# Altium project Audio-Switch-v2.0.PrjPcb (part 2 of 3)

## Sheet I2S-to-SPDIF-Sheet.SchDoc
size 420 x 297 mm; SheetNumber: 5; SheetTotal: 5
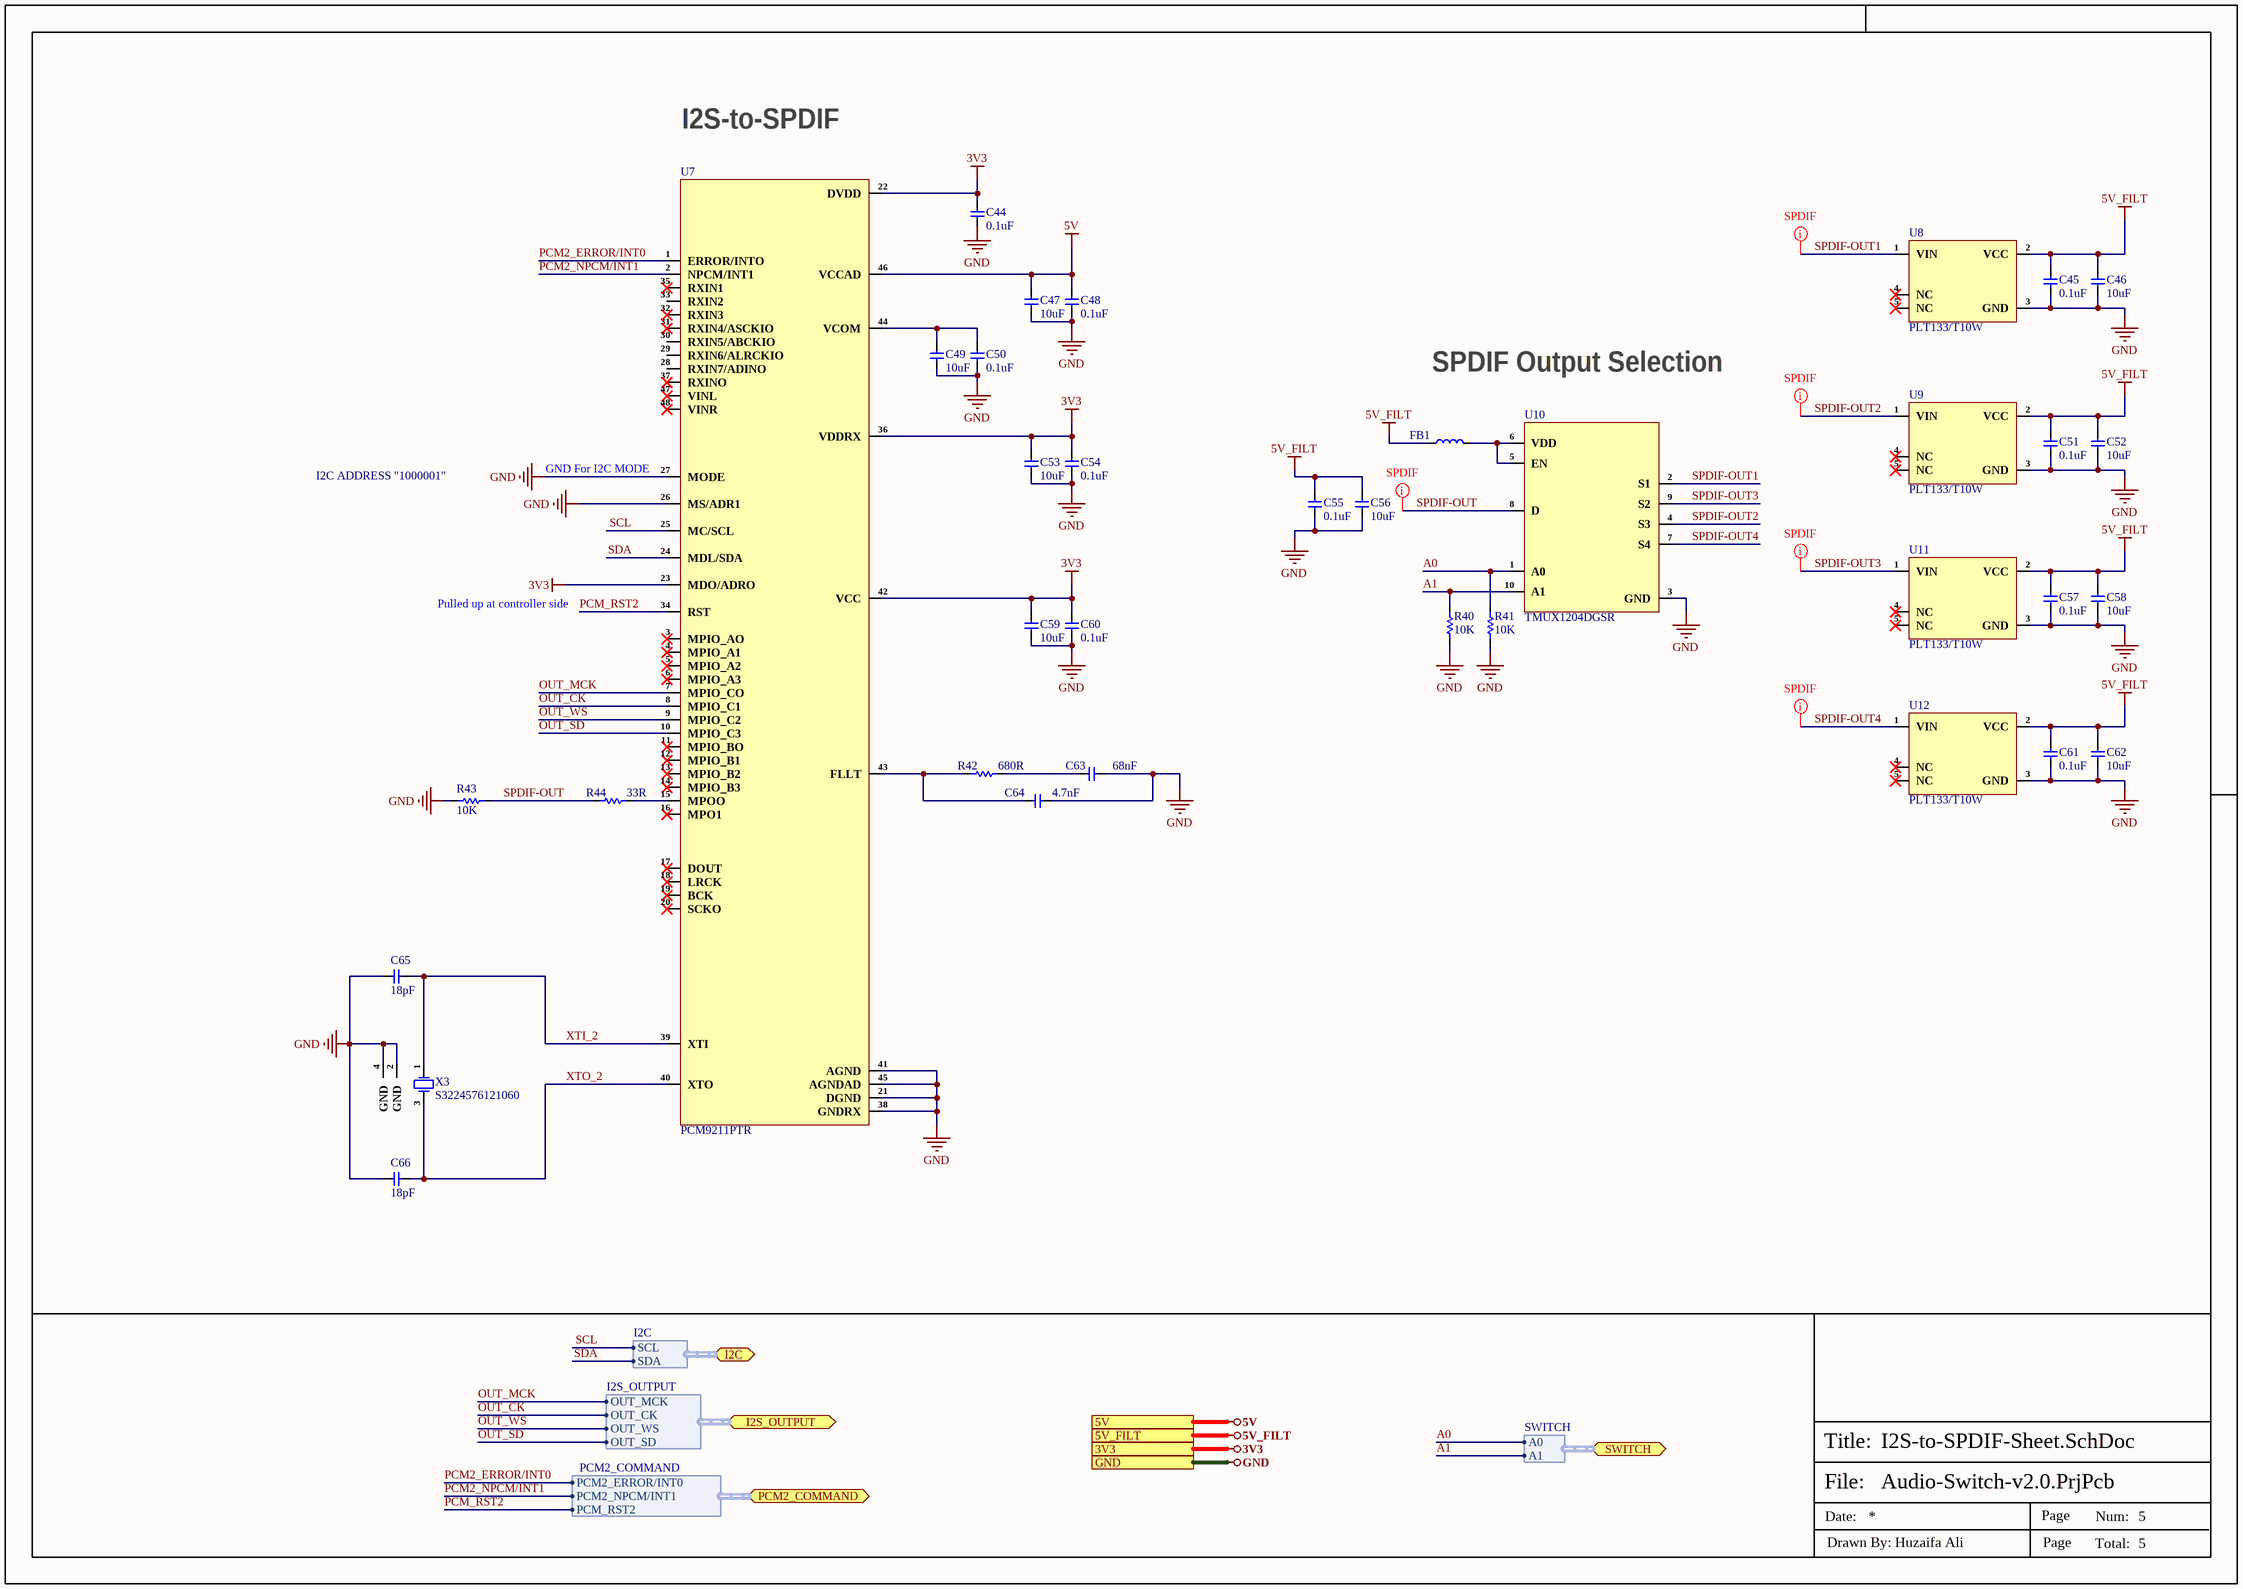
[diagram p2: I2S-to-SPDIF-Sheet.SchDoc]

### Parts
C44  0.1uF  [Cap-0402]
C45  0.1uF  [Cap-0402]
C46  10uF  [Cap-0402]
C47  10uF  [Cap-0402]
C48  0.1uF  [Cap-0402]
C49  10uF  [Cap-0402]
C50  0.1uF  [Cap-0402]
C51  0.1uF  [Cap-0402]
C52  10uF  [Cap-0402]
C53  10uF  [Cap-0402]
C54  0.1uF  [Cap-0402]
C55  0.1uF  [Cap-0402]
C56  10uF  [Cap-0402]
C57  0.1uF  [Cap-0402]
C58  10uF  [Cap-0402]
C59  10uF  [Cap-0402]
C60  0.1uF  [Cap-0402]
C61  0.1uF  [Cap-0402]
C62  10uF  [Cap-0402]
C63  68nF  [Cap-0402]
C64  4.7nF  [Cap-0402]
C65  18pF  [Cap-0402]
C66  18pF  [Cap-0402]
FB1  BLM18SG121TN1D  [IND-0603 (1608 Metric)]  (value not drawn)
R40  10K  [Res-0402]
R41  10K  [Res-0402]
R42  680R  [Res-0402]
R43  10K  [Res-0402]
R44  33R  [Res-0402]
U7  PCM9211PTR  [48-LQFP (7x7)]
U8  PLT133/T10W  [PLT133/T10W]
U9  PLT133/T10W  [PLT133/T10W]
U10  TMUX1204DGSR  [VSSOP-10]
U11  PLT133/T10W  [PLT133/T10W]
U12  PLT133/T10W  [PLT133/T10W]
X3  S3224576121060  [S3224576121060_]

### Ports
3V3 (see Top_Sheet[5B], Controller-Sheet[2D], Power-Sheet[4D], SPDIF-to-I2S-Sheet[3D]), 5V (see Top_Sheet[5A], Power-Sheet[4D], SPDIF-to-I2S-Sheet[3D]), 5V_FILT (see Top_Sheet[5A], Power-Sheet[4D], SPDIF-to-I2S-Sheet[3D]), GND (see Top_Sheet[5B], Controller-Sheet[2D], Power-Sheet[4D], SPDIF-to-I2S-Sheet[3D]), I2C (bidir, harness I2C, see Top_Sheet[5B], Controller-Sheet[2D], SPDIF-to-I2S-Sheet[2D]), I2S_OUTPUT (bidir, harness I2S_OUTPUT, see Top_Sheet[5B], Controller-Sheet[4D]), PCM2_COMMAND (bidir, harness PCM2_COMMAND, see Top_Sheet[5B], Controller-Sheet[5D]), SWITCH (bidir, harness SWITCH, see Top_Sheet[5B], Controller-Sheet[4D])

### Harnesses
I2C: SCL, SDA
PCM2_COMMAND: PCM2_ERROR/INT0, PCM2_NPCM/INT1, PCM_RST2
SWITCH: A0, A1
I2S_OUTPUT: OUT_MCK, OUT_CK, OUT_WS, OUT_SD

### Nets
3V3: C44.2 C53.2 C54.2 C59.2 C60.2 U7.22(DVDD) U7.23(MDO/ADRO) U7.36(VDDRX) U7.42(VCC) ; port 3V3
5V: C47.2 C48.2 U7.46(VCCAD) ; port 5V
5V_FILT: C45.2 C46.2 C51.2 C52.2 C55.2 C56.2 C57.2 C58.2 C61.2 C62.2 FB1.1 U8.2(VCC) U9.2(VCC) U11.2(VCC) U12.2(VCC) ; port 5V_FILT
GND: C44.1 C45.1 C46.1 C47.1 C48.1 C49.1 C50.1 C51.1 C52.1 C53.1 C54.1 C55.1 C56.1 C57.1 C58.1 C59.1 C60.1 C61.1 C62.1 C63.2 C64.2 C65.1 C66.1 R40.1 R41.1 R43.1 U7.21(DGND) U7.26(MS/ADR1) U7.27(MODE) U7.38(GNDRX) U7.41(AGND) U7.45(AGNDAD) U8.3(GND) U9.3(GND) U10.3(GND) U11.3(GND) U12.3(GND) X3.2(GND) X3.4(GND) ; port GND
A0: R41.2 U10.1(A0) ; port SWITCH.A0
A1: R40.2 U10.10(A1) ; port SWITCH.A1
OUT_CK: U7.8(MPIO_C1) ; port I2S_OUTPUT.OUT_CK
OUT_MCK: U7.7(MPIO_CO) ; port I2S_OUTPUT.OUT_MCK
OUT_SD: U7.10(MPIO_C3) ; port I2S_OUTPUT.OUT_SD
OUT_WS: U7.9(MPIO_C2) ; port I2S_OUTPUT.OUT_WS
PCM2_ERROR/INT0: U7.1(ERROR/INTO) ; port PCM2_COMMAND.PCM2_ERROR/INT0
PCM2_NPCM/INT1: U7.2(NPCM/INT1) ; port PCM2_COMMAND.PCM2_NPCM/INT1
PCM_RST2: U7.34(RST) ; port PCM2_COMMAND.PCM_RST2
SCL: U7.25(MC/SCL) ; port I2C.SCL  [project net I2C.SCL]
SDA: U7.24(MDL/SDA) ; port I2C.SDA  [project net I2C.SDA]
SPDIF-OUT: R43.2 R44.1 U10.8(D)
SPDIF-OUT1: U8.1(VIN) U10.2(S1)
SPDIF-OUT2: U9.1(VIN) U10.4(S3)
SPDIF-OUT3: U10.9(S2) U11.1(VIN)
SPDIF-OUT4: U10.7(S4) U12.1(VIN)
XTI_2: C65.2 U7.39(XTI) X3.1(OSC1)
XTO_2: C66.2 U7.40(XTO) X3.3(OSC2)
NetC49_2: C49.2 C50.2 U7.44(VCOM)
NetC63_1: C63.1 R42.2
NetC64_1: C64.1 R42.1 U7.43(FLLT)
NetFB1_2: FB1.2 U10.5(EN) U10.6(VDD)
NetR44_2: R44.2 U7.15(MPOO)

Not connected (* = marked no-connect by the designer): U7 3(MPIO_AO)* 4(MPIO_A1)* 5(MPIO_A2)* 6(MPIO_A3)* 11(MPIO_BO)* 12(MPIO_B1)* 13(MPIO_B2)* 14(MPIO_B3)* 16(MPO1)* 17(DOUT)* 18(LRCK)* 19(BCK)* 20(SCKO)* 28(RXIN7/ADINO) 29(RXIN6/ALRCKIO) 30(RXIN5/ABCKIO) 31(RXIN4/ASCKIO)* 32(RXIN3)* 33(RXIN2) 35(RXIN1)* 37(RXINO)* 47(VINL)* 48(VINR)*; U8 4(NC)* 5(NC)*; U9 4(NC)* 5(NC)*; U11 4(NC)* 5(NC)*; U12 4(NC)* 5(NC)*

### Layout directives
net class SPDIF: SPDIF-OUT, SPDIF-OUT1, SPDIF-OUT2, SPDIF-OUT3, SPDIF-OUT4

### Notes on the sheet
- I2S-to-SPDIF
- SPDIF Output Selection
- I2C ADDRESS "1000001"
- (near U7) GND For I2C MODE
- Pulled up at controller side
- File:
- Title:
- Date:
- Page
- Num:
- Total:
- Drawn By: Huzaifa Ali

### Library data of the parts
C44 C45 C48 C50 C51 C54 C55 C57 C60 C61 = CC0402KRX7R8BB104: CAP CER 0.1UF 25V X7R 0402; Manufacturer: Yageo; Tolerance: 10%; Capacitance: 100nF; Dissipation Factor: 3.5%; Supplier 1: Digi-Key; Manufacturer Part Number: CC0402KRX7R8BB104; RoHS: Yes; Category: Ceramic Capacitors; Stock 1: 1841009; Pricing 1: 1=0.10000, 10=0.03100, 50=0.01700, 100=0.01390, 500=0.00990, 1000=0.00777, 2500=0.00707, 5000=0.00650 (USD); Mount: Surface Mount; Case/Package: 0402; Case Code (Imperial): 0402; Case Code (Metric): 1005; Min Operating Temperature: -55°C; Max Operating Temperature: 125°C; Dielectric: X7R; Voltage Rating: 25V; Voltage Rating (DC): 25V; Packaging: Tape and Reel; Termination: SMD/SMT; Resistor Type: Ceramic; Length: 1mm; Width: 0.02inch; Height: 0.5mm; Thickness: 0.022inch; Depth: 0.5mm; Radiation Hardening: No; Lead Free: Lead Free; Halogen Free: Halogen Free; ComponentLink1URL: https://datasheet.ciiva.com/11464/upy-gphc-x7r-6-3v-to-50v-8-11464889.pdf?src-supplier=Avnet; ComponentLink1Description: https://datasheet.ciiva.com/11464/upy-gphc-x7r-6-3v-to-50v-8-11464889.pdf?src-supplier=Avnet; ComponentLink2URL: https://datasheet.ciiva.com/13210/upy-gphc-x7r-6-3v-to-50v-8-12304-13210908.pdf?src-supplier=Mouser; ComponentLink2Description: https://datasheet.ciiva.com/13210/upy-gphc-x7r-6-3v-to-50v-8-12304-13210908.pdf?src-supplier=Mouser; ComponentLink3URL: https://datasheet.ciiva.com/17437/upy-gphc-x7r-6-3v-to-50v-8-17437357.pdf?src-supplier=Avnet+Europe; ComponentLink3Description: https://datasheet.ciiva.com/17437/upy-gphc-x7r-6-3v-to-50v-8-17437357.pdf?src-supplier=Avnet+Europe; Supplier Part Number 1: 311-2077-1-ND; LCSC Part Number: C105883
C46 C47 C49 C52 C53 C56 C58 C59 C62 = CL05A106MP5NUNC: CAP CER 10UF 10V X5R 0402; Manufacturer: Samsung; Tolerance: 20%; Item Type: Capacitor; Supplier 1: Avnet; Manufacturer Part Number: CL05A106MP5NUNC; RoHS: Yes; Category: Ceramic Capacitors; Stock 1: 1729850; Pricing 1: 10000=0.02537 (USD); Mount: Surface Mount; Case/Package: 0402; Case Code (Metric): 1005; Case Code (Imperial): 0402; Contact Plating: Tin; Min Operating Temperature: -55°C; Max Operating Temperature: 85°C; Package Quantity: 1; Packaging: Tape and Reel; Capacitance: 10uF; Voltage Rating: 10V; Dielectric: X5R; Termination: Wraparound; Series: CL; Construction: Flat; Length: 1mm; Width: 0.02inch; Thickness: 0.028inch; Depth: 0.5mm; Radiation Hardening: No; Lead Free: Lead Free; RoHS Compliant: Yes; ComponentLink1URL: https://datasheet.ciiva.com/25721/cl05a106mp5nunc-25721584.pdf?src-supplier=Digi-Key; ComponentLink1Description: https://datasheet.ciiva.com/25721/cl05a106mp5nunc-25721584.pdf?src-supplier=Digi-Key; ComponentLink2URL: https://datasheet.ciiva.com/26838/getdatasheetpartid-745310-26838170.pdf?src-supplier=Verical; ComponentLink2Description: https://datasheet.ciiva.com/26838/getdatasheetpartid-745310-26838170.pdf?src-supplier=Verical; Supplier Part Number 1: CL05A106MP5NUNC; LCSC Part Number: C315248
C63 = CC0402KRX7R9BB683: CAP CER 0.068UF 50V X7R 0402; Manufacturer: Yageo; Dielectric: 1511DielectricType; Item Type: Capacitor; Supplier 1: Future Electronics; Manufacturer Part Number: CC0402KRX7R9BB683; RoHS: Yes; Category: Ceramic Capacitors; Stock 1: 100000; Pricing 1: 10000=0.0035, 40000=0.0033, 100000=0.0032, 250000=0.0031, 400000=0.0029 (USD); Case/Package: 343Case; Capacitance: 68nF; Voltage Rating (DC): 50V; Halogen Free: 5694HalogenFree; Lead Free: 5697LeadFree; Supplier Part Number 1: 2106471
C64 = CC0402KRX7R9BB472: CAP CER 4700PF 50V X7R 0402; Manufacturer: Yageo; Material: 4241ConductorMaterial; Tolerance: 10%; Temperature Coefficient: 30ppm/°C; Item Type: Capacitor; Supplier 1: Future Electronics; Manufacturer Part Number: CC0402KRX7R9BB472; RoHS: Yes; Category: Ceramic Capacitors; Stock 1: 1780000; Pricing 1: 10000=0.0021, 40000=0.002, 150000=0.0019, 400000=0.0018, 1000000=0.0017 (USD); Mount: Surface Mount; Case/Package: 0402; Number of Pins: 2NUMBER; Case Code (Imperial): 0402; Case Code (Metric): 1005; Min Operating Temperature: -55°C; Max Operating Temperature: 125°C; Capacitance: 4.7nF; Dielectric: X7R; Voltage Rating: 50V; Voltage Rating (DC): 50V; Packaging: Tape and Reel; Package Quantity: 1; Termination: SMD/SMT; Series: CC; Construction: Flat; Length: 1mm; Width: 0.02inch; Height: 0.5mm; Thickness: 0.022inch; Depth: 0.5mm; Radiation Hardening: No; Reach SVHC Compliant: No; RoHS Compliant: Yes; Halogen Free: 5694HalogenFree; Lead Free: 5697LeadFree; ComponentLink1URL: https://datasheet.ciiva.com/7978/1489800-7978108.pdf?src-supplier=Element14; ComponentLink1Description: https://datasheet.ciiva.com/7978/1489800-7978108.pdf?src-supplier=Element14; ComponentLink2URL: https://datasheet.ciiva.com/176/mlccorderingcode-176364.pdf?src-supplier=Digikey; ComponentLink2Description: https://datasheet.ciiva.com/176/mlccorderingcode-176364.pdf?src-supplier=Digikey; ComponentLink3URL: https://datasheet.ciiva.com/176/mlccorderingcode-176363.pdf?src-supplier=Digikey; ComponentLink3Description: https://datasheet.ciiva.com/176/mlccorderingcode-176363.pdf?src-supplier=Digikey; ComponentLink4URL: https://datasheet.ciiva.com/176/mlccorderingcode-176365.pdf?src-supplier=Digikey; ComponentLink4Description: https://datasheet.ciiva.com/176/mlccorderingcode-176365.pdf?src-supplier=Digikey; ComponentLink5URL: https://datasheet.ciiva.com/11586/upy-gphc-x7r-6-3v-to-50v-8-11586491.pdf?src-supplier=Avnet; ComponentLink5Description: https://datasheet.ciiva.com/11586/upy-gphc-x7r-6-3v-to-50v-8-11586491.pdf?src-supplier=Avnet; Supplier Part Number 1: 1989300
C65 C66 = GCM1555C1H180GA16D: CAP CER 18PF 50V C0G/NP0 0402; Manufacturer: Murata; Tolerance: 2%; Item Type: Capacitor; Supplier: Rs; Supplier Part Number: 2477793P; Manufacturer Part Number: GCM1555C1H180GA16D; RoHS: Yes; Category: Ceramic Capacitors; Stock: 10000; Pricing: 500=0.013, 5000=0.009 (GBP); Mounting Technology: Surface Mount; Case/Package: 0402; Case Code (Imperial): 0402; Case Code (Metric): 1005; Min Operating Temperature: -55°C; Max Operating Temperature: 125°C; Packaging: Cut Tape; Value: 18pF; Voltage Rating: 50V; Series: GCM; Ratings: AEC-Q200; RoHS Compliant: Yes; ComponentLink1URL: http://search.murata.co.jp/Ceramy/image/img/A01X/G101/ENG/GCM1555C1H180GA16-01.pdf?src-supplier=Digi-Key; ComponentLink1Description: http://search.murata.co.jp/Ceramy/image/img/A01X/G101/ENG/GCM1555C1H180GA16-01.pdf?src-supplier=Digi-Key; ComponentLink2URL: https://search.murata.co.jp/Ceramy/image/img/A01X/G101/ENG/GCM1555C1H180GA16-01.pdf?src-supplier=Digi-Key; ComponentLink2Description: https://search.murata.co.jp/Ceramy/image/img/A01X/G101/ENG/GCM1555C1H180GA16-01.pdf?src-supplier=Digi-Key; ComponentLink3URL: https://datasheet.octopart.com/GCM1555C1H180GA16D-Murata-datasheet-149522315.pdf?src-supplier=Newark; ComponentLink3Description: https://datasheet.octopart.com/GCM1555C1H180GA16D-Murata-datasheet-149522315.pdf?src-supplier=Newark; ComponentLink4URL: https://datasheet.octopart.com/GCM1555C1H180GA16D-Murata-datasheet-12511495.pdf?src-supplier=TME; ComponentLink4Description: https://datasheet.octopart.com/GCM1555C1H180GA16D-Murata-datasheet-12511495.pdf?src-supplier=TME; LCSC Part Number: C882583
FB1 = BLM18SG121TN1D: FERRITE BEAD 120 OHM 0603 1LN; Manufacturer: Murata; Material: Steel,Ferrite; Tolerance: 25%; Impedance: 120R; DC Resistance (DCR): 25mR; Max DC Current: 3A; Number of Lines: 1; Test Frequency: 100MHz; Shielding: Unshielded; Supplier 1: Arrow Electronics; Manufacturer Part Number: BLM18SG121TN1D; RoHS: Yes; Category: Ferrite Beads and Chips; Stock 1: 82612; Pricing 1: 1=0.12640, 10=0.08350, 25=0.07210, 100=0.05150, 250=0.04730, 500=0.04110, 1000=0.03420, 3000=0.03360, 6000=0.03320, 15000=0.03270, 30000=0.03200, 75000=0.03150 (USD); Case/Package: 0603; Number of Pins: 2; Core Material: Ferrite; Case Code (Metric): 1608; Case Code (Imperial): 0603; Min Operating Temperature: -55°C; Max Operating Temperature: 125°C; Package Quantity: 1; Max Current Rating: 3A; Packaging: Tape and Reel; Current Rating: 3A; Termination: SMD/SMT; Frequency: 100MHz; Number of Circuits: 1; Series: BLM18S; DC Resistance-Max: 25mR; Length: 1.6mm; Width: 0.8mm; Height: 0.8mm; Depth: 0.8mm; Reach SVHC Compliant: Yes; Lead Free: Lead Free; RoHS Compliant: Yes; ComponentLink1URL: https://datasheet.ciiva.com/1012/l0110s0100blm18s-1012624.pdf?src-supplier=Digi-Key; ComponentLink1Description: https://datasheet.ciiva.com/1012/l0110s0100blm18s-1012624.pdf?src-supplier=Digi-Key; ComponentLink2URL: https://datasheet.ciiva.com/11799/0900766b811b5866-11799181.pdf?src-supplier=RSComponents; ComponentLink2Description: https://datasheet.ciiva.com/11799/0900766b811b5866-11799181.pdf?src-supplier=RSComponents; ComponentLink3URL: https://datasheet.ciiva.com/18093/getdatasheetpartid-295885-18093249.pdf?src-supplier=Verical; ComponentLink3Description: https://datasheet.ciiva.com/18093/getdatasheetpartid-295885-18093249.pdf?src-supplier=Verical; ComponentLink4URL: https://datasheet.ciiva.com/41449/001171723-da-01-en-chip-drossel0603-120r-3000ma-1-6x0-8mm-41449353.pdf?src-supplier=Conrad; ComponentLink4Description: https://datasheet.ciiva.com/41449/001171723-da-01-en-chip-drossel0603-120r-3000ma-1-6x0-8mm-41449353.pdf?src-supplier=Conrad; ComponentLink5URL: https://datasheet.ciiva.com/41449/001172312-da-01-en-drossel-0603-120r-1-6x0-8mm-10000st-41449675.pdf?src-supplier=Conrad; ComponentLink5Description: https://datasheet.ciiva.com/41449/001172312-da-01-en-drossel-0603-120r-1-6x0-8mm-10000st-41449675.pdf?src-supplier=Conrad; ComponentLink6URL: https://datasheet.ciiva.com/8021/5151-8021511.pdf?src-supplier=Element14; ComponentLink6Description: https://datasheet.ciiva.com/8021/5151-8021511.pdf?src-supplier=Element14; ComponentLink7URL: https://datasheet.ciiva.com/8021/5151-8021512.pdf?src-supplier=Element14; ComponentLink7Description: https://datasheet.ciiva.com/8021/5151-8021512.pdf?src-supplier=Element14; ComponentLink8URL: https://datasheet.ciiva.com/14122/blm-series-eng-tds-14122906.pdf?src-supplier=Distrelec; ComponentLink8Description: https://datasheet.ciiva.com/14122/blm-series-eng-tds-14122906.pdf?src-supplier=Distrelec; ComponentLink9URL: https://datasheet.ciiva.com/1012/l0110s0100blm18s-1012623.pdf?src-supplier=Digi-Key; ComponentLink9Description: https://datasheet.ciiva.com/1012/l0110s0100blm18s-1012623.pdf?src-supplier=Digi-Key; ComponentLink10URL: https://datasheet.ciiva.com/1012/l0110s0100blm18s-1012625.pdf?src-supplier=Digi-Key; ComponentLink10Description: https://datasheet.ciiva.com/1012/l0110s0100blm18s-1012625.pdf?src-supplier=Digi-Key; ComponentLink11URL: https://datasheet.ciiva.com/16395/l0110s0100blm18s-16395498.pdf?src-supplier=Future+Electronics; ComponentLink11Description: https://datasheet.ciiva.com/16395/l0110s0100blm18s-16395498.pdf?src-supplier=Future+Electronics; Supplier Part Number 1: BLM18SG121TN1D; LCSC Part Number: C113030; Item Type: Ferrite Bead
R40 R41 R43 = RC0402FR-0710KL: RES 10K OHM 1% 1/16W 0402; Manufacturer: Yageo; Resistance: 10kR; Voltage Rating (DC): 50V; Temperature Coefficient: 100ppm/°C; Power Rating: 62.5mW; Max Power Dissipation: 63mW; Item Type: Resistor; Supplier 1: Mouser; Manufacturer Part Number: RC0402FR-0710KL; RoHS: Yes; Category: Chip SMD Resistors; Stock 1: 18648329; Pricing 1: 1=0.10000, 10=0.01400, 50=0.01400, 100=0.00500, 1000=0.00300, 10000=0.00200 (USD); Case/Package: 0402; Number of Pins: 2; Case Code (Imperial): 0402; Case Code (Metric): 1005; Min Operating Temperature: -55°C; Max Operating Temperature: 155°C; Resistor Type: Thick Film; Tolerance: 1%; Packaging: Tape and Reel; Voltage Rating: 50V; Termination: SMD/SMT; Working Voltage: 50V; Number of Terminations: 2; Features: Moisture Resistant; Series: RC; Resistance Tolerance: 1%; Construction: Rectangular; Length: 1mm; Width: 0.5mm; Height: 0.32mm; Depth: 0.5mm; Lead Pitch: 0.2mm; REACH SVHC: No SVHC; Lead Free: Lead Free; RoHS Compliant: Yes; Military Standard: Not; ComponentLink1URL: https://datasheet.ciiva.com/7660/38568-7660787.pdf?src-supplier=Element14; ComponentLink1Description: https://datasheet.ciiva.com/7660/38568-7660787.pdf?src-supplier=Element14; ComponentLink2URL: https://datasheet.ciiva.com/7849/1686128-7849814.pdf?src-supplier=Element14; ComponentLink2Description: https://datasheet.ciiva.com/7849/1686128-7849814.pdf?src-supplier=Element14; ComponentLink3URL: https://datasheet.ciiva.com/7983/1018594-7983486.pdf?src-supplier=Element14; ComponentLink3Description: https://datasheet.ciiva.com/7983/1018594-7983486.pdf?src-supplier=Element14; ComponentLink4URL: https://datasheet.ciiva.com/22747/1018594-22747512.pdf?src-supplier=Element14; ComponentLink4Description: https://datasheet.ciiva.com/22747/1018594-22747512.pdf?src-supplier=Element14; ComponentLink5URL: https://datasheet.ciiva.com/12667/pyu-rc0402-51-rohs-l-6-r-12667067.pdf?src-supplier=Mouser; ComponentLink5Description: https://datasheet.ciiva.com/12667/pyu-rc0402-51-rohs-l-6-r-12667067.pdf?src-supplier=Mouser; ComponentLink6URL: https://datasheet.ciiva.com/7849/1784430-7849813.pdf?src-supplier=Element14; ComponentLink6Description: https://datasheet.ciiva.com/7849/1784430-7849813.pdf?src-supplier=Element14; ComponentLink7URL: https://datasheet.ciiva.com/7849/1784430-7849815.pdf?src-supplier=Element14; ComponentLink7Description: https://datasheet.ciiva.com/7849/1784430-7849815.pdf?src-supplier=Element14; Supplier Part Number 1: 603-RC0402FR-0710KL; LCSC Part Number: C60490
R42 = RC0402FR-07680RL: RES 680 OHM 1% 1/16W 0402; Manufacturer: Yageo; Temperature Coefficient: 100ppm/°C; Power Rating: 63mW; Voltage Rating: 50V; Item Type: Resistor; Supplier 1: Future Electronics; Manufacturer Part Number: RC0402FR-07680RL; RoHS: Yes; Category: Chip SMD Resistors; Stock 1: 5080000; Pricing 1: 10000=0.0011, 100000=0.0011, 300000=0.001, 750000=0.001, 2000000=0.0009 (USD); Case/Package: 0402; Case Code (Imperial): 0402; Case Code (Metric): 1005; Size Code: 0402; Min Operating Temperature: -55°C; Max Operating Temperature: 155°C; Resistance: 680R; Tolerance: 1%; Packaging: Tape and Reel; Resistor Type: Thick Film; Termination: SMD/SMT; Features: Moisture Resistant; Series: RC; Max Power Dissipation: 63mW; Number of Terminations: 2; Resistance Tolerance: 1%; Construction: Rectangular; Voltage Rating (AC): 50V; Length: 1mm; Depth: 0.5mm; Reach SVHC Compliant: No; Lead Free: Lead Free; Military Standard: Not; RoHS Compliant: Yes; ComponentLink1URL: https://datasheet.ciiva.com/12667/pyu-rc0402-51-rohs-l-6-r-12667916.pdf?src-supplier=Mouser; ComponentLink1Description: https://datasheet.ciiva.com/12667/pyu-rc0402-51-rohs-l-6-r-12667916.pdf?src-supplier=Mouser; ComponentLink2URL: https://datasheet.ciiva.com/7850/1018594-7850071.pdf?src-supplier=Element14; ComponentLink2Description: https://datasheet.ciiva.com/7850/1018594-7850071.pdf?src-supplier=Element14; ComponentLink3URL: https://datasheet.ciiva.com/7850/1018594-7850070.pdf?src-supplier=Element14; ComponentLink3Description: https://datasheet.ciiva.com/7850/1018594-7850070.pdf?src-supplier=Element14; ComponentLink4URL: https://datasheet.ciiva.com/17042/pyu-rc0402-51-rohs-l-6-r-17042399.pdf?src-supplier=Future+Electronics; ComponentLink4Description: https://datasheet.ciiva.com/17042/pyu-rc0402-51-rohs-l-6-r-17042399.pdf?src-supplier=Future+Electronics; Supplier Part Number 1: 7948052
R44 = RC0402FR-0733RL: RES 33 OHM 1% 1/16W 0402; Manufacturer: Yageo; Power Rating: 62.5mW; Voltage Rating: 50V; Temperature Coefficient: 100ppm/°C; Max Power Dissipation: 63mW; Supplier 1: Mouser; Manufacturer Part Number: RC0402FR-0733RL; RoHS: Yes; Category: Chip SMD Resistors; Stock 1: 1843488; Pricing 1: 1=0.10000, 10=0.01200, 50=0.01200, 100=0.00500, 1000=0.00300, 10000=0.00100 (USD); Case/Package: 0402; Number of Pins: 2; Case Code (Imperial): 0402; Case Code (Metric): 1005; Size Code: 0402; Min Operating Temperature: -55°C; Max Operating Temperature: 155°C; Resistor Type: Thick Film; Resistance: 33R; Tolerance: 1%; Packaging: Tape and Reel; Voltage Rating (DC): 50V; Package Quantity: 10000; Termination: SMD/SMT; Features: Moisture Resistant; Series: RC; Number of Terminations: 2; Resistance Tolerance: 1%; Construction: Rectangular; Technology: THICK FILM; Length: 1mm; Width: 0.5mm; Height: 0.35mm; Depth: 0.5mm; RoHS Compliant: Yes; REACH SVHC: Unknown; Military Standard: Not; Lead Free: Lead Free; ComponentLink1URL: https://datasheet.ciiva.com/11819/0900766b80c66297-11819487.pdf?src-supplier=RSComponents; ComponentLink1Description: https://datasheet.ciiva.com/11819/0900766b80c66297-11819487.pdf?src-supplier=RSComponents; ComponentLink2URL: https://datasheet.ciiva.com/24070/pyu-rc0402-51-rohs-l-6-r-8721-24070077.pdf?src-supplier=Mouser; ComponentLink2Description: https://datasheet.ciiva.com/24070/pyu-rc0402-51-rohs-l-6-r-8721-24070077.pdf?src-supplier=Mouser; ComponentLink3URL: https://datasheet.ciiva.com/7849/1018594-7849967.pdf?src-supplier=Element14; ComponentLink3Description: https://datasheet.ciiva.com/7849/1018594-7849967.pdf?src-supplier=Element14; ComponentLink4URL: https://datasheet.ciiva.com/7849/1018594-7849966.pdf?src-supplier=Element14; ComponentLink4Description: https://datasheet.ciiva.com/7849/1018594-7849966.pdf?src-supplier=Element14; ComponentLink5URL: https://datasheet.ciiva.com/15189/getdatasheetpartid-329253-15189431.pdf?src-supplier=Verical; ComponentLink5Description: https://datasheet.ciiva.com/15189/getdatasheetpartid-329253-15189431.pdf?src-supplier=Verical; ComponentLink6URL: https://datasheet.ciiva.com/17070/pyu-rc0402-51-rohs-l-6-r-17070335.pdf?src-supplier=Future+Electronics; ComponentLink6Description: https://datasheet.ciiva.com/17070/pyu-rc0402-51-rohs-l-6-r-17070335.pdf?src-supplier=Future+Electronics; Supplier Part Number 1: 603-RC0402FR-0733RL; LCSC Part Number: C138002
U7 = PCM9211PTR: IC AUDIO TRANSCEIVER 48LQFP; Manufacturer: Texas Instruments; Item Type: Amplifiers - Audio; Supplier: Mouser; Supplier Part Number: 595-PCM9211PTR; Manufacturer Part Number: PCM9211PTR; RoHS: Yes; Stock: 2280; Pricing: 1=3.06, 10=2.74, 50=2.74, 100=2.51, 1000=1.8, 10000=1.49 (USD); ComponentLink1URL: https://datasheet.ciiva.com/1825/pcm9211-1825949.pdf?src-supplier=Digikey; ComponentLink1Description: https://datasheet.ciiva.com/1825/pcm9211-1825949.pdf?src-supplier=Digikey; ComponentLink2URL: https://datasheet.ciiva.com/3026/sbas495-3026720.pdf?src-supplier=Avnet; ComponentLink2Description: https://datasheet.ciiva.com/3026/sbas495-3026720.pdf?src-supplier=Avnet; ComponentLink3URL: https://datasheet.ciiva.com/1825/pcm9211-1825950.pdf?src-supplier=Digikey; ComponentLink3Description: https://datasheet.ciiva.com/1825/pcm9211-1825950.pdf?src-supplier=Digikey; ComponentLink4URL: https://datasheet.ciiva.com/1825/pcm9211-1825951.pdf?src-supplier=Digikey; ComponentLink4Description: https://datasheet.ciiva.com/1825/pcm9211-1825951.pdf?src-supplier=Digikey
U8 U9 U11 U12 = PLT133/T10W: TRANSMITTER FBR OPT IR PHOTOLINK; Manufacturer: Everlight; Item Type: IC; Data Rate: 16Mbps; Operating Supply Voltage: 5V; Wavelength: 660nm; Supply Current: 3mA; Supplier: Digikey; Supplier Part Number: 1080-1430-ND; Manufacturer Part Number: PLT133/T10W; RoHS: Yes; Stock: 13385; Pricing: 1=3.09, 60=2.0575, 120=1.58333, 540=1.4313, 1020=1.23002, 2040=1.16293, 5040=1.13609 (USD); Min Operating Temperature: -20°C; Max Operating Temperature: 70°C; Package Quantity: 500; Series: -; Lead Free: Lead Free; RoHS Compliant: Yes; ComponentLink1URL: http://components.arrow.com/part/dataview/47954421S9333883N2104?src-supplier=Arrow+Electronics; ComponentLink1Description: http://components.arrow.com/part/dataview/47954421S9333883N2104?src-supplier=Arrow+Electronics; ComponentLink2URL: http://www.everlight.com/file/ProductFile/PLT133-T10W.pdf?src-supplier=Digikey; ComponentLink2Description: http://www.everlight.com/file/ProductFile/PLT133-T10W.pdf?src-supplier=Digikey; ComponentLink3URL: http://www.everlight.com/index.php?option=com_k2&view=item&id=271:transmitter-plt-module&Itemid=264&lang=en&src-supplier=Mouser; ComponentLink3Description: http://www.everlight.com/index.php?option=com_k2&view=item&id=271:transmitter-plt-module&Itemid=264&lang=en&src-supplier=Mouser; ComponentLink4URL: http://www.everlight.com/datasheets/PLT133_T9_datasheet.pdf?src-supplier=Future+Electronics; ComponentLink4Description: http://www.everlight.com/datasheets/PLT133_T9_datasheet.pdf?src-supplier=Future+Electronics; LCSC Part Number: C2940206
U10 = TMUX1204DGSR: IC SWITCH SP4T X 1 5OHM 10VSSOP; Manufacturer: Texas Instruments; Supplier: Mouser; Supplier Part Number: 595-TMUX1204DGSR; Manufacturer Part Number: TMUX1204DGSR; RoHS: Yes; Item Type: IC; Stock: 10828; Pricing: 1=0.94, 10=0.776, 50=0.776, 100=0.589, 1000=0.401, 10000=0.325 (USD); ComponentLink1URL: http://www.ti.com/general/docs/suppproductinfo.tsp?distId=10&amp;gotoUrl=http%3A%2F%2Fwww.ti.com%2Flit%2Fgpn%2Ftmux1204&src-supplier=Digikey; ComponentLink1Description: http://www.ti.com/general/docs/suppproductinfo.tsp?distId=10&amp;gotoUrl=http%3A%2F%2Fwww.ti.com%2Flit%2Fgpn%2Ftmux1204&src-supplier=Digikey; LCSC Part Number: C2840022
X3 = S3224576121060: 24.576MHz SMD Crystal Resonator 12pF 60Ω ±10ppm -40℃~+85℃ SMD3225-4P Crystals ROHS; Manufacturer: JGHC; Manufacturer Part Number: S3224576121060; Footprint: Custom; ComponentLink1Description: LCSC; ComponentLink1URL: https://lcsc.com/product-detail/Crystals_JGHC-S3224576121060_C390772.html; Value: 24.576MHz; LCSC Part Number: C390772